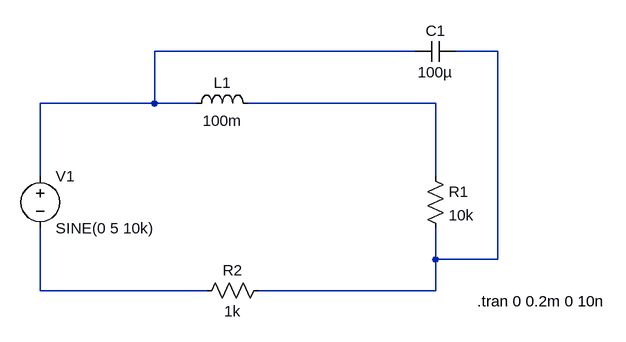
[diagram p0: schematic draft2.asc]
draft2.asc, the LTspice schematic file:
Version 4.1
SHEET 1 1016 680
WIRE 704 -128 304 -128
WIRE 832 -128 768 -128
WIRE 304 -48 304 -128
WIRE 304 -48 128 -48
WIRE 368 -48 304 -48
WIRE 736 -48 448 -48
WIRE 128 64 128 -48
WIRE 736 64 736 -48
WIRE 736 192 736 144
WIRE 832 192 832 -128
WIRE 832 192 736 192
WIRE 128 240 128 144
WIRE 384 240 128 240
WIRE 736 240 736 192
WIRE 736 240 464 240
SYMBOL voltage 128 48 R0
WINDOW 123 0 0 Left 0
WINDOW 39 0 0 Left 0
SYMATTR InstName V1
SYMATTR Value SINE(0 5 10k)
SYMBOL ind 352 -32 R270
WINDOW 0 32 56 VTop 2
WINDOW 3 5 56 VBottom 2
SYMATTR InstName L1
SYMATTR Value 100m
SYMATTR SpiceLine Rser=1m
SYMBOL res 720 48 R0
SYMATTR InstName R1
SYMATTR Value 10k
SYMBOL res 480 224 R90
WINDOW 0 0 56 VBottom 2
WINDOW 3 32 56 VTop 2
SYMATTR InstName R2
SYMATTR Value 1k
SYMBOL cap 768 -144 R90
WINDOW 0 0 32 VBottom 2
WINDOW 3 32 32 VTop 2
SYMATTR InstName C1
SYMATTR Value 100µ
TEXT 800 256 Left 2 !.tran 0 0.2m 0 10n

The netlist it stands for:
* draft2.asc
V1 N001 N004 SINE(0 5 10k)
L1 N001 N003 100m Rser=1m
R1 N003 N002 10k
R2 N002 N004 1k
C1 N002 N001 100µ
.tran 0 0.2m 0 10n
.backanno
.end